# Altium schematic sheet Zasilanie_ADC.SchDoc
size A3
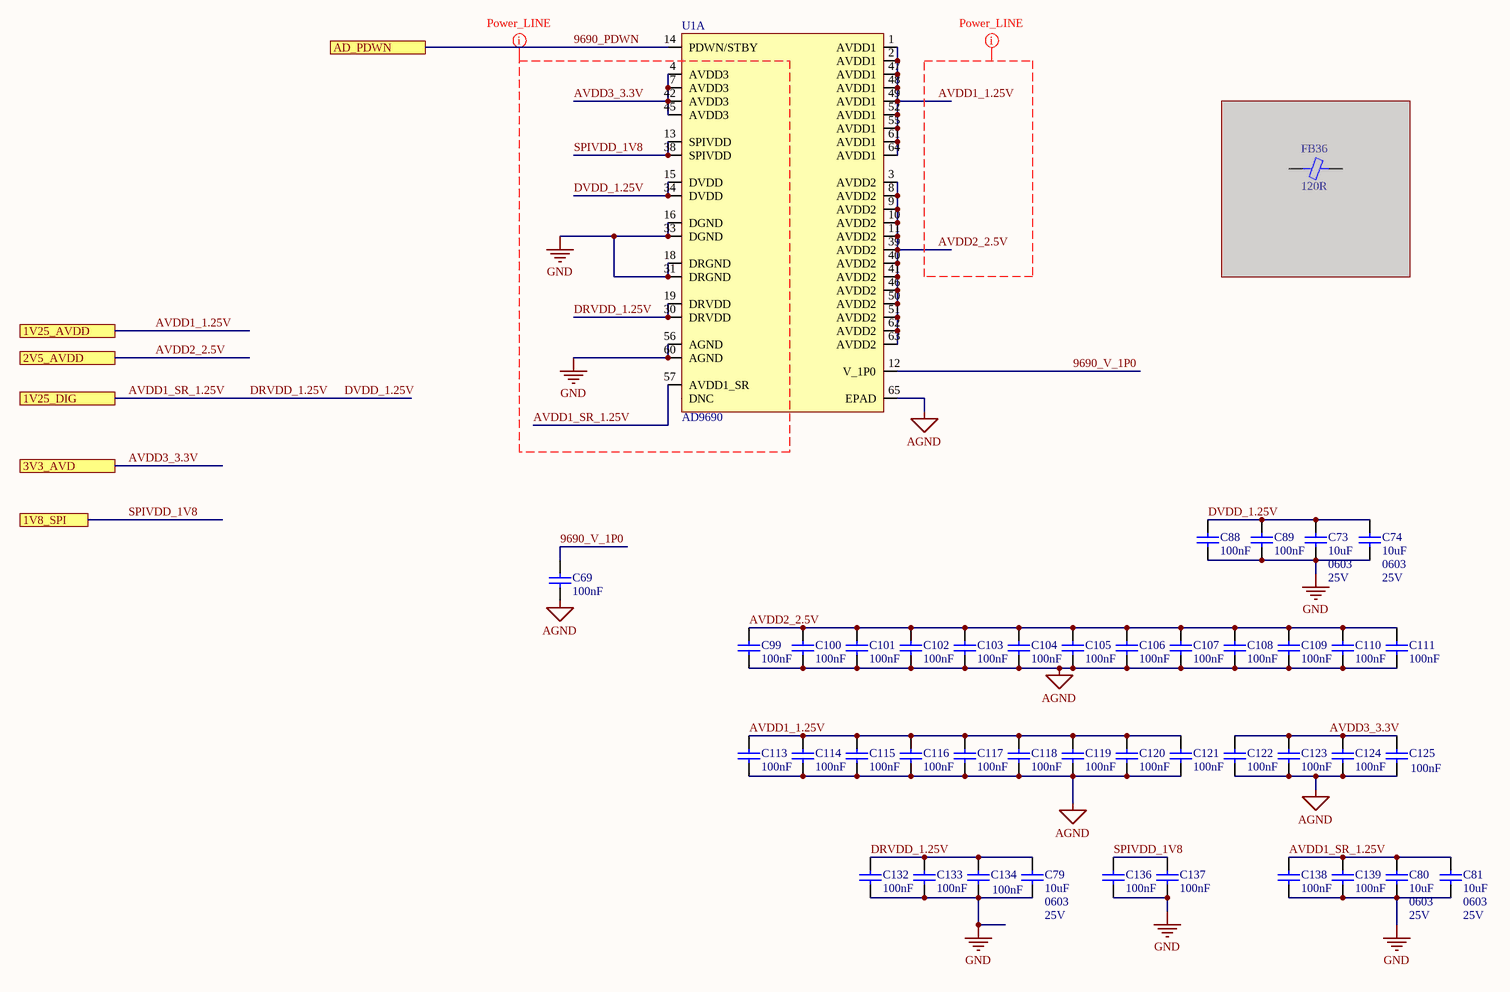
[diagram p0: Zasilanie_ADC.SchDoc]

## Parts
C69  100nF  [CAP 0201/0603 KK]
C73  10uF  Case/Package: 0603  Voltage Rating: 25V  [CAP 0603/1608 RF]
C74  10uF  Case/Package: 0603  Voltage Rating: 25V  [CAP 0603/1608 RF]
C79  10uF  Case/Package: 0603  Voltage Rating: 25V  [CAP 0603/1608 RF]
C80  10uF  Case/Package: 0603  Voltage Rating: 25V  [CAP 0603/1608 RF]
C81  10uF  Case/Package: 0603  Voltage Rating: 25V  [CAP 0603/1608 RF]
C88  100nF  [CAP 0201/0603 KK]
C89  100nF  [CAP 0201/0603 KK]
C99  100nF  [CAP 0201/0603 KK]
C100  100nF  [CAP 0201/0603 KK]
C101  100nF  [CAP 0201/0603 KK]
C102  100nF  [CAP 0201/0603 KK]
C103  100nF  [CAP 0201/0603 KK]
C104  100nF  [CAP 0201/0603 KK]
C105  100nF  [CAP 0201/0603 KK]
C106  100nF  [CAP 0201/0603 KK]
C107  100nF  [CAP 0201/0603 KK]
C108  100nF  [CAP 0201/0603 KK]
C109  100nF  [CAP 0201/0603 KK]
C110  100nF  [CAP 0201/0603 KK]
C111  100nF  [CAP 0201/0603 KK]
C113  100nF  [CAP 0201/0603 KK]
C114  100nF  [CAP 0201/0603 KK]
C115  100nF  [CAP 0201/0603 KK]
C116  100nF  [CAP 0201/0603 KK]
C117  100nF  [CAP 0201/0603 KK]
C118  100nF  [CAP 0201/0603 KK]
C119  100nF  [CAP 0201/0603 KK]
C120  100nF  [CAP 0201/0603 KK]
C121  100nF  [CAP 0201/0603 KK]
C122  100nF  [CAP 0201/0603 KK]
C123  100nF  [CAP 0201/0603 KK]
C124  100nF  [CAP 0201/0603 KK]
C125  100nF  [CAP 0201/0603 KK]
C132  100nF  [CAP 0201/0603 KK]
C133  100nF  [CAP 0201/0603 KK]
C134  100nF  [CAP 0201/0603 KK]
C136  100nF  [CAP 0201/0603 KK]
C137  100nF  [CAP 0201/0603 KK]
C138  100nF  [CAP 0201/0603 KK]
C139  100nF  [CAP 0201/0603 KK]
FB36  120R  [FER 0603/1608 KK]  (masked out: inside a compile mask, not in the netlist)
U1  AD9690  [AD9690]  (part A of 3)

## Ports
1V8_SPI, 1V25_AVDD, 1V25_DIG, 2V5_AVDD, 3V3_AVD, AD_PDWN

## Nets
AGND: C69.1 C99.1 C100.1 C101.1 C102.1 C103.1 C104.1 C105.1 C106.1 C107.1 C108.1 C109.1 C110.1 C111.1 C113.1 C114.1 C115.1 C116.1 C117.1 C118.1 C119.1 C120.1 C121.1 C122.1 C123.1 C124.1 C125.1 U1.65(EPAD)
GND: C73.1 C74.1 C79.1 C80.1 C81.1 C88.1 C89.1 C132.1 C133.1 C134.1 C136.1 C137.1 C138.1 C139.1 U1.16(DGND) U1.18(DRGND) U1.31(DRGND) U1.33(DGND) U1.56(AGND) U1.60(AGND)
9690_PDWN: U1.14(PDWN/STBY) ; port AD_PDWN
9690_V_1P0: C69.2 U1.12(V_1P0)
AVDD1_1.25V: C113.2 C114.2 C115.2 C116.2 C117.2 C118.2 C119.2 C120.2 C121.2 U1.1(AVDD1) U1.2(AVDD1) U1.47(AVDD1) U1.48(AVDD1) U1.49(AVDD1) U1.52(AVDD1) U1.55(AVDD1) U1.61(AVDD1) U1.64(AVDD1) ; port 1V25_AVDD
AVDD1_SR_1.25V: C73.2 C74.2 C79.2 C80.2 C81.2 C88.2 C89.2 C132.2 C133.2 C134.2 C138.2 C139.2 U1.15(DVDD) U1.19(DRVDD) U1.30(DRVDD) U1.34(DVDD) U1.57(AVDD1_SR) ; port 1V25_DIG  [also labelled DRVDD_1.25V, DVDD_1.25V]
AVDD2_2.5V: C99.2 C100.2 C101.2 C102.2 C103.2 C104.2 C105.2 C106.2 C107.2 C108.2 C109.2 C110.2 C111.2 U1.3(AVDD2) U1.8(AVDD2) U1.9(AVDD2) U1.10(AVDD2) U1.11(AVDD2) U1.39(AVDD2) U1.40(AVDD2) U1.41(AVDD2) U1.46(AVDD2) U1.50(AVDD2) U1.51(AVDD2) U1.62(AVDD2) U1.63(AVDD2) ; port 2V5_AVDD
AVDD3_3.3V: C122.2 C123.2 C124.2 C125.2 U1.4(AVDD3) U1.7(AVDD3) U1.42(AVDD3) U1.45(AVDD3) ; port 3V3_AVD
SPIVDD_1V8: C136.2 C137.2 U1.13(SPIVDD) U1.38(SPIVDD) ; port 1V8_SPI

Not connected (* = marked no-connect by the designer): U1 44, 43, 32(DNC)

## Layout directives
net class Power_LINE: AVDD1_1.25V, AVDD1_SR_1.25V, AVDD2_2.5V, AVDD3_3.3V, DRVDD_1.25V, DVDD_1.25V, GND, SPIVDD_1V8

## Notes on the sheet
- Title
- Size:
- Date:
- A3
- Number:
- Time:
- Revision:
- Sheet
- of
- File:

## Library data of the parts
C69 C88 C89 C99-C111 C113-C125 C132-C134 C136-C139 = Capacitor: Manufacturer 1: Murata; Manufacturer Part Number 1: GRM033R61C104ME84D; Voltage Rating: 16V; Tolerance: 20%; Dielectric: X5R; Supplier 1: Digi-Key; Supplier Part Number 1: 490-9986-1-ND; Stock 1: 550070; Pricing 1: 1=0.10000, 10=0.05400, 100=0.02430, 500=0.01732, 1000=0.01361, 2500=0.01238, 5000=0.01139 (USD); RoHS: Yes; Mount: Surface Mount; Case/Package: 0201; Weight: 1.2E-05oz; Case Code (Metric): 0603; Case Code (Imperial): 0201; Min Operating Temperature: -55°C; Max Operating Temperature: 85°C; Capacitance: 100nF; Packaging: Tape and Reel; Termination: SMD/SMT; Voltage Rating (DC): 16V; Package Quantity: 15000; Length: 0.024inch; Height: 0.3mm; Width: 0.3mm; Thickness: 0.013inch
  C69 C88 C89 C99-C111 C113-C125: ComponentLink1URL: http://search.murata.co.jp/Ceramy/image/img/A01X/G101/ENG/GRM033R61C104KE84-01.pdf?src-supplier=Digi-Key; ComponentLink1Description: http://search.murata.co.jp/Ceramy/image/img/A01X/G101/ENG/GRM033R61C104KE84-01.pdf?src-supplier=Digi-Key; ComponentLink2URL: https://search.murata.co.jp/Ceramy/image/img/A01X/G101/ENG/GRM033R61C104KE84-01.pdf?src-supplier=Digi-Key; ComponentLink2Description: https://search.murata.co.jp/Ceramy/image/img/A01X/G101/ENG/GRM033R61C104KE84-01.pdf?src-supplier=Digi-Key; ComponentLink3URL: http://www.mouser.com/ds/2/281/c02e-2905.pdf?src-supplier=Mouser; ComponentLink3Description: http://www.mouser.com/ds/2/281/c02e-2905.pdf?src-supplier=Mouser; ComponentLink4URL: http://search.murata.co.jp/Ceramy/image/img/A01X/G101/ENG/GRM033R61C104ME84-01.pdf?src-supplier=Digi-Key; ComponentLink4Description: http://search.murata.co.jp/Ceramy/image/img/A01X/G101/ENG/GRM033R61C104ME84-01.pdf?src-supplier=Digi-Key
  C132-C134 C136-C139: ComponentLink1URL: http://www.mouser.com/ds/2/281/c02e-2905.pdf?src-supplier=Mouser; ComponentLink1Description: http://www.mouser.com/ds/2/281/c02e-2905.pdf?src-supplier=Mouser; ComponentLink2URL: http://search.murata.co.jp/Ceramy/image/img/A01X/G101/ENG/GRM033R61C104ME84-01.pdf?src-supplier=Digi-Key; ComponentLink2Description: http://search.murata.co.jp/Ceramy/image/img/A01X/G101/ENG/GRM033R61C104ME84-01.pdf?src-supplier=Digi-Key
C73 C74 C79-C81 = Capacitor: Cap Ceramic 10uF 25V X5R 20% Pad SMD 0603 85C T/R; Manufacturer: Taiyo Yuden; Manufacturer Part Number: TMK107BBJ106MA-T; Supplier 1: Digi-Key; Supplier Part Number 1: 587-6023-1-ND; RoHS: No; Category: Ceramic Capacitors; Stock 1: 261658; Pricing 1: 1=0,44000, 10=0,30600, 50=0,21400, 100=0,18350, 500=0,13762, 1000=0,11620 (USD); Mount: Surface Mount; Case Code (Imperial): 0603; Case Code (Metric): 1608; Min Operating Temperature: -55°C; Max Operating Temperature: 85°C; Packaging: Tape and Reel; Capacitance: 10uF; Tolerance: 20%; Lead Free: Lead Free; ComponentLink1URL: http://ds.yuden.co.jp/TYCOMPAS/ut/detail.do?productNo=TMK107BBJ106MA-T&fileName=TMK107BBJ106MA-T_SS&mode=specSheetDownload&src-supplier=Digi-Key; ComponentLink1Description: http://ds.yuden.co.jp/TYCOMPAS/ut/detail.do?productNo=TMK107BBJ106MA-T&fileName=TMK107BBJ106MA-T_SS&mode=specSheetDownload&src-supplier=Digi-Key
FB36 = Ferrite: Manufacturer 1: Murata; Manufacturer Part Number 1: BLM18EG121SN1D; Material: Steel,Ferrite; Tolerance: 25%; Max Current Rating: 2A; DC Resistance (DCR): 40mR; Number of Lines: 1; Test Frequency: 100MHz; Supplier 1: Digi-Key; Supplier Part Number 1: 490-3991-6-ND; Stock 1: 15177; Pricing 1: 1=0.23000, 10=0.17500, 25=0.14520, 50=0.12520, 100=0.11260, 250=0.09508, 500=0.08508, 1000=0.07257 (USD); RoHS: Yes; Case/Package: 0603; Number of Pins: 2; Weight: 7.1E-05oz; Case Code (Metric): 1608; Case Code (Imperial): 0603; Core Material: Ferrite; Min Operating Temperature: -55°C; Max Operating Temperature: 125°C; Impedance: 120R; Package Quantity: 1; Packaging: Tape and Reel; Max DC Current: 2A; Current Rating: 2A; Termination: SMD/SMT; Number of Circuits: 1; DC Current: 2A; Frequency: 100MHz; Military Standard: Not; Length: 1.6mm; Height: 0.8mm; Width: 0.8mm; Depth: 0.8mm; Radiation Hardening: No; Lead Free: Lead Free; REACH SVHC: No SVHC; ComponentLink1URL: https://datasheet.ciiva.com/34302/1844926-34302803.pdf?src-supplier=Jameco; ComponentLink1Description: https://datasheet.ciiva.com/34302/1844926-34302803.pdf?src-supplier=Jameco; ComponentLink2URL: https://datasheet.ciiva.com/11795/0900766b811b5866-11795397.pdf?src-supplier=RSComponents; ComponentLink2Description: https://datasheet.ciiva.com/11795/0900766b811b5866-11795397.pdf?src-supplier=RSComponents; ComponentLink3URL: https://datasheet.ciiva.com/41449/001171698-da-01-en-chip-drossel0603-120r-2000ma-1-6x0-8mm-41449378.pdf?src-supplier=Conrad; ComponentLink3Description: https://datasheet.ciiva.com/41449/001171698-da-01-en-chip-drossel0603-120r-2000ma-1-6x0-8mm-41449378.pdf?src-supplier=Conrad; ComponentLink4URL: https://datasheet.ciiva.com/41449/001172264-da-01-en-drossel-0603-120r-1-6x0-8mm-4000st-41449582.pdf?src-supplier=Conrad; ComponentLink4Description: https://datasheet.ciiva.com/41449/001172264-da-01-en-drossel-0603-120r-1-6x0-8mm-4000st-41449582.pdf?src-supplier=Conrad; ComponentLink5URL: https://datasheet.ciiva.com/1467/5169-1467155.pdf?src-supplier=Element14; ComponentLink5Description: https://datasheet.ciiva.com/1467/5169-1467155.pdf?src-supplier=Element14; ComponentLink6URL: https://datasheet.ciiva.com/1467/5169-1467156.pdf?src-supplier=Element14; ComponentLink6Description: https://datasheet.ciiva.com/1467/5169-1467156.pdf?src-supplier=Element14; ComponentLink7URL: https://datasheet.ciiva.com/18092/getdatasheetpartid-120977-18092965.pdf?src-supplier=Verical; ComponentLink7Description: https://datasheet.ciiva.com/18092/getdatasheetpartid-120977-18092965.pdf?src-supplier=Verical; ComponentLink8URL: https://datasheet.ciiva.com/6211/l0110s0101blm18e-6211463.pdf?src-supplier=Digi-Key; ComponentLink8Description: https://datasheet.ciiva.com/6211/l0110s0101blm18e-6211463.pdf?src-supplier=Digi-Key; ComponentLink9URL: https://datasheet.ciiva.com/16387/l0110s0101blm18e-16387655.pdf?src-supplier=Future+Electronics; ComponentLink9Description: https://datasheet.ciiva.com/16387/l0110s0101blm18e-16387655.pdf?src-supplier=Future+Electronics; ComponentLink10URL: https://datasheet.ciiva.com/3081/l0110s0101blm18e-3081624.pdf?src-supplier=Avnet; ComponentLink10Description: https://datasheet.ciiva.com/3081/l0110s0101blm18e-3081624.pdf?src-supplier=Avnet; ComponentLink11URL: https://datasheet.ciiva.com/14122/blm-series-eng-tds-14122904.pdf?src-supplier=Distrelec; ComponentLink11Description: https://datasheet.ciiva.com/14122/blm-series-eng-tds-14122904.pdf?src-supplier=Distrelec; ComponentLink12URL: https://datasheet.ciiva.com/17279/l0110s0101blm18e-17279548.pdf?src-supplier=Avnet+Europe; ComponentLink12Description: https://datasheet.ciiva.com/17279/l0110s0101blm18e-17279548.pdf?src-supplier=Avnet+Europe
U1 = AD9690: Manufacturer: Analog Devices; Manufacturer Part Number: AD9690BCPZ-500; Number of Bits: 14; Sampling Rate: 500MS/s; Number of Inputs: 1; Min Supply Voltage: 3.2V; Max Supply Voltage: 3.4V; Interface: Serial; Resolution: 14b; Supply Type: Single; Differential Nonlinearity: 0.5LSB; Integral Nonlinearity (INL): 2.5LSB; Power Dissipation: 1.5W; Supplier 1: Digi-Key; Supplier Part Number 1: AD9690BCPZ-500-ND; Stock 1: 6; Pricing 1: 1 = 199,64000, 10 = 191,20500, 25 = 186,98720 (USD); RoHS: Yes; Mount: Surface Mount; Number of Pins: 64; Min Operating Temperature: -40°C; Max Operating Temperature: 85°C; Packaging: Tray; Number of A/D Converters: 1; REACH SVHC: No SVHC; Lead Free: Lead Free; ComponentLink1URL: http://www.mouser.com/ds/2/609/AD9690-534148.pdf?src-supplier=Mouser; ComponentLink1Description: http://www.mouser.com/ds/2/609/AD9690-534148.pdf?src-supplier=Mouser; ComponentLink2URL: http://www.analog.com/media/en/technical-documentation/data-sheets/AD9690.pdf?src-supplier=Digi-Key; ComponentLink2Description: http://www.analog.com/media/en/technical-documentation/data-sheets/AD9690.pdf?src-supplier=Digi-Key; ComponentLink3URL: http://www.farnell.com/datasheets/2146909.pdf?src-supplier=Element14; ComponentLink3Description: http://www.farnell.com/datasheets/2146909.pdf?src-supplier=Element14; ComponentLink4URL: http://www.analog.com/media/en/technical-documentation/data-sheets/AD9690.pdf?src-supplier=Avnet; ComponentLink4Description: http://www.analog.com/media/en/technical-documentation/data-sheets/AD9690.pdf?src-supplier=Avnet